# Altium schematic sheet PCB_Down.SchDoc
size A1
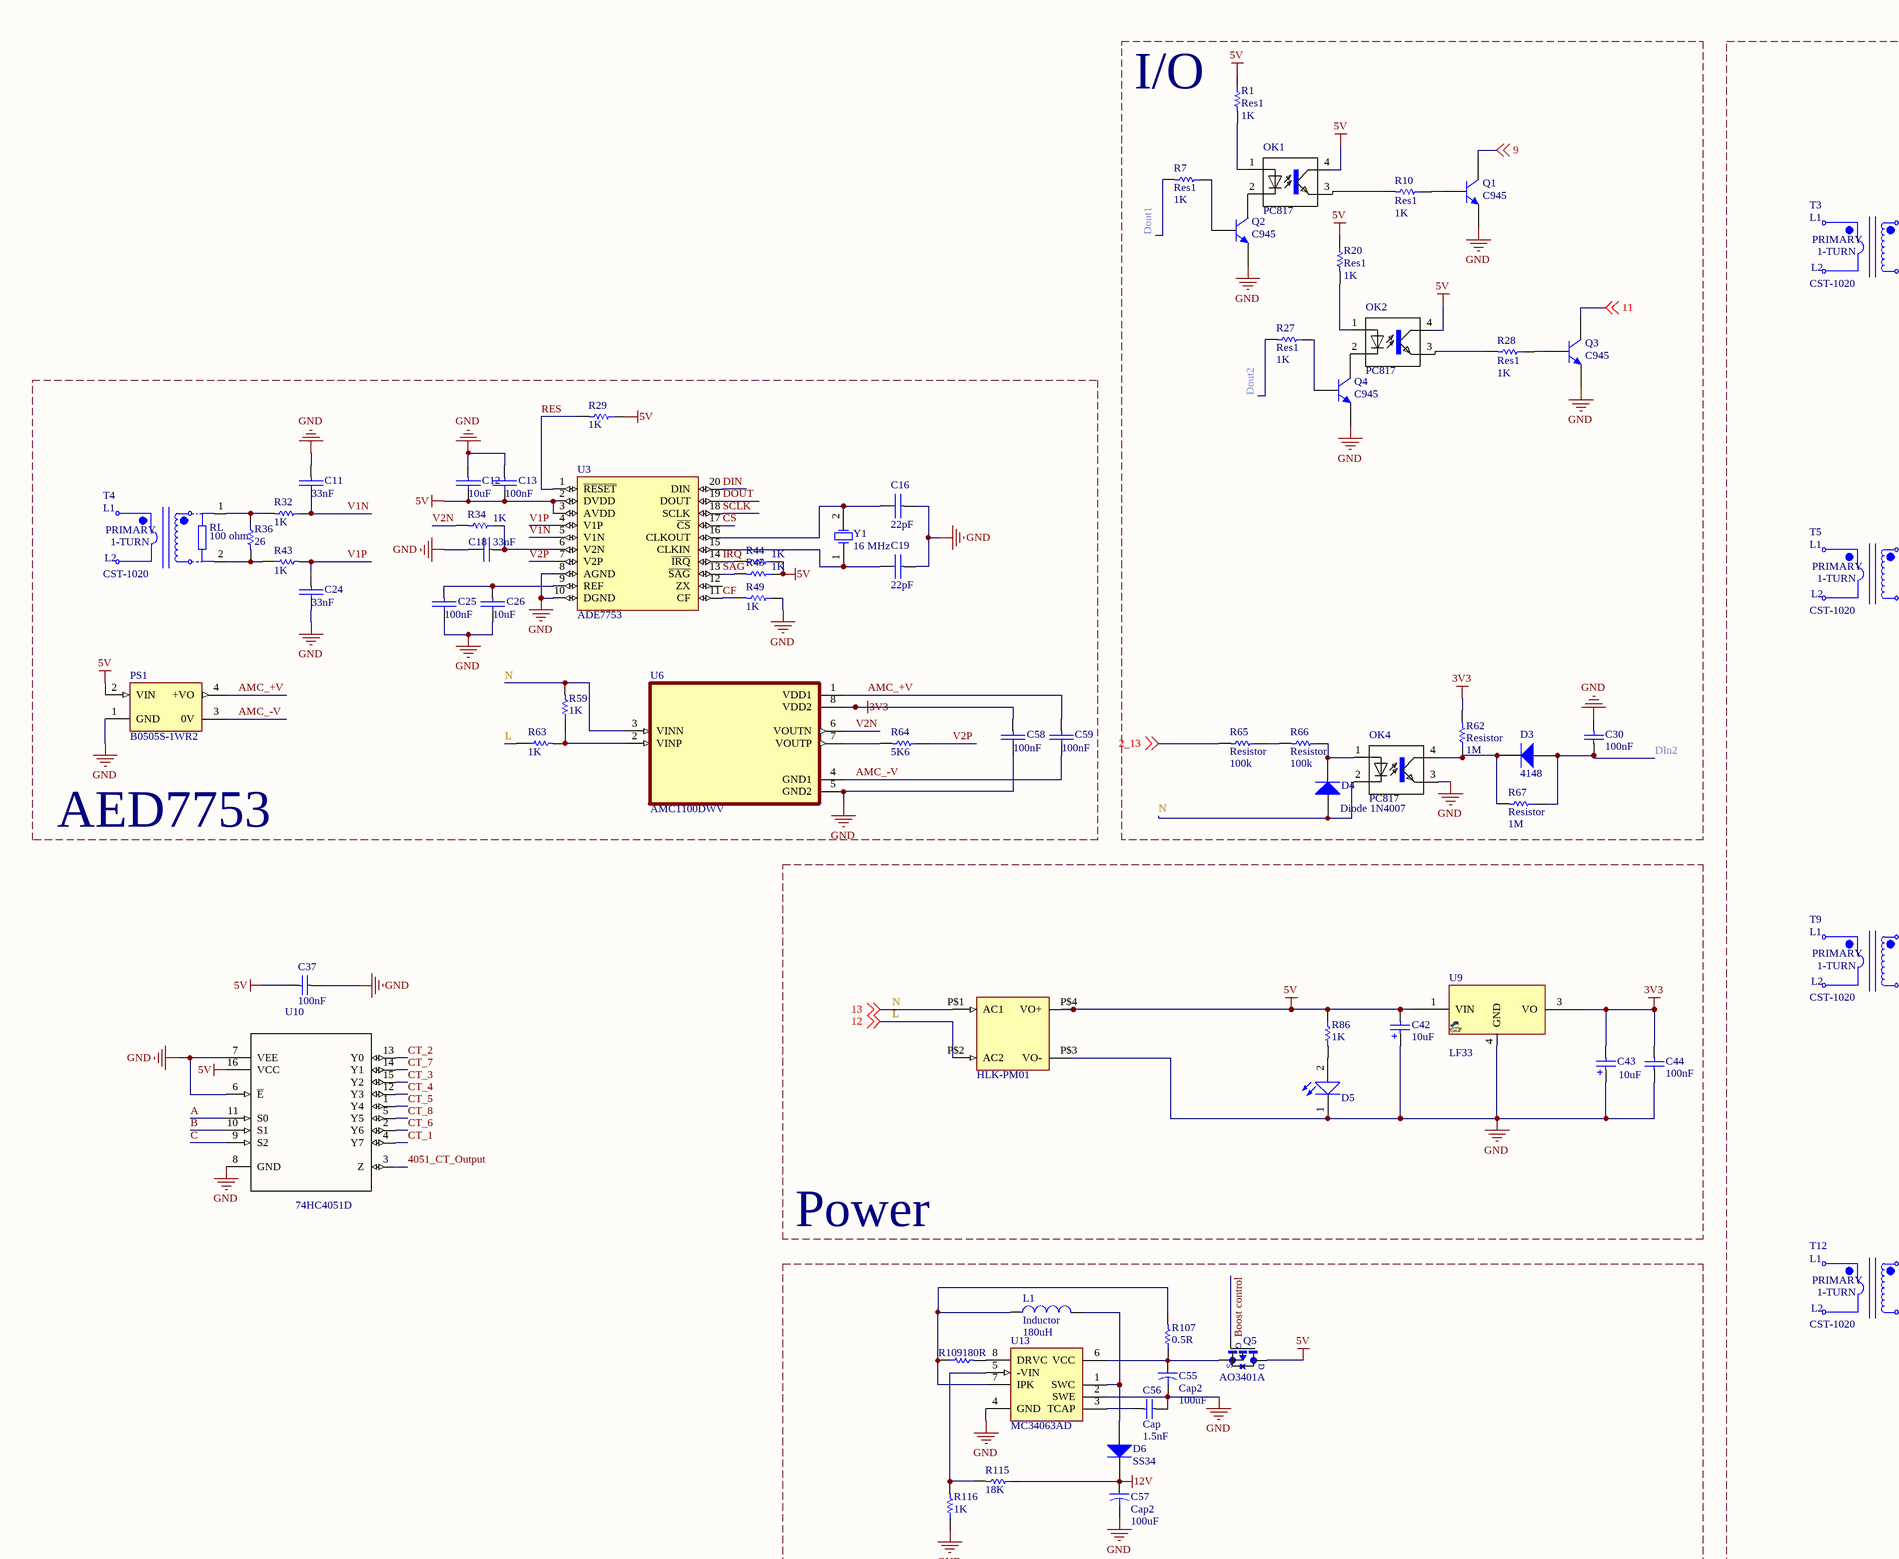
[diagram p0: PCB_Down.SchDoc, top left]
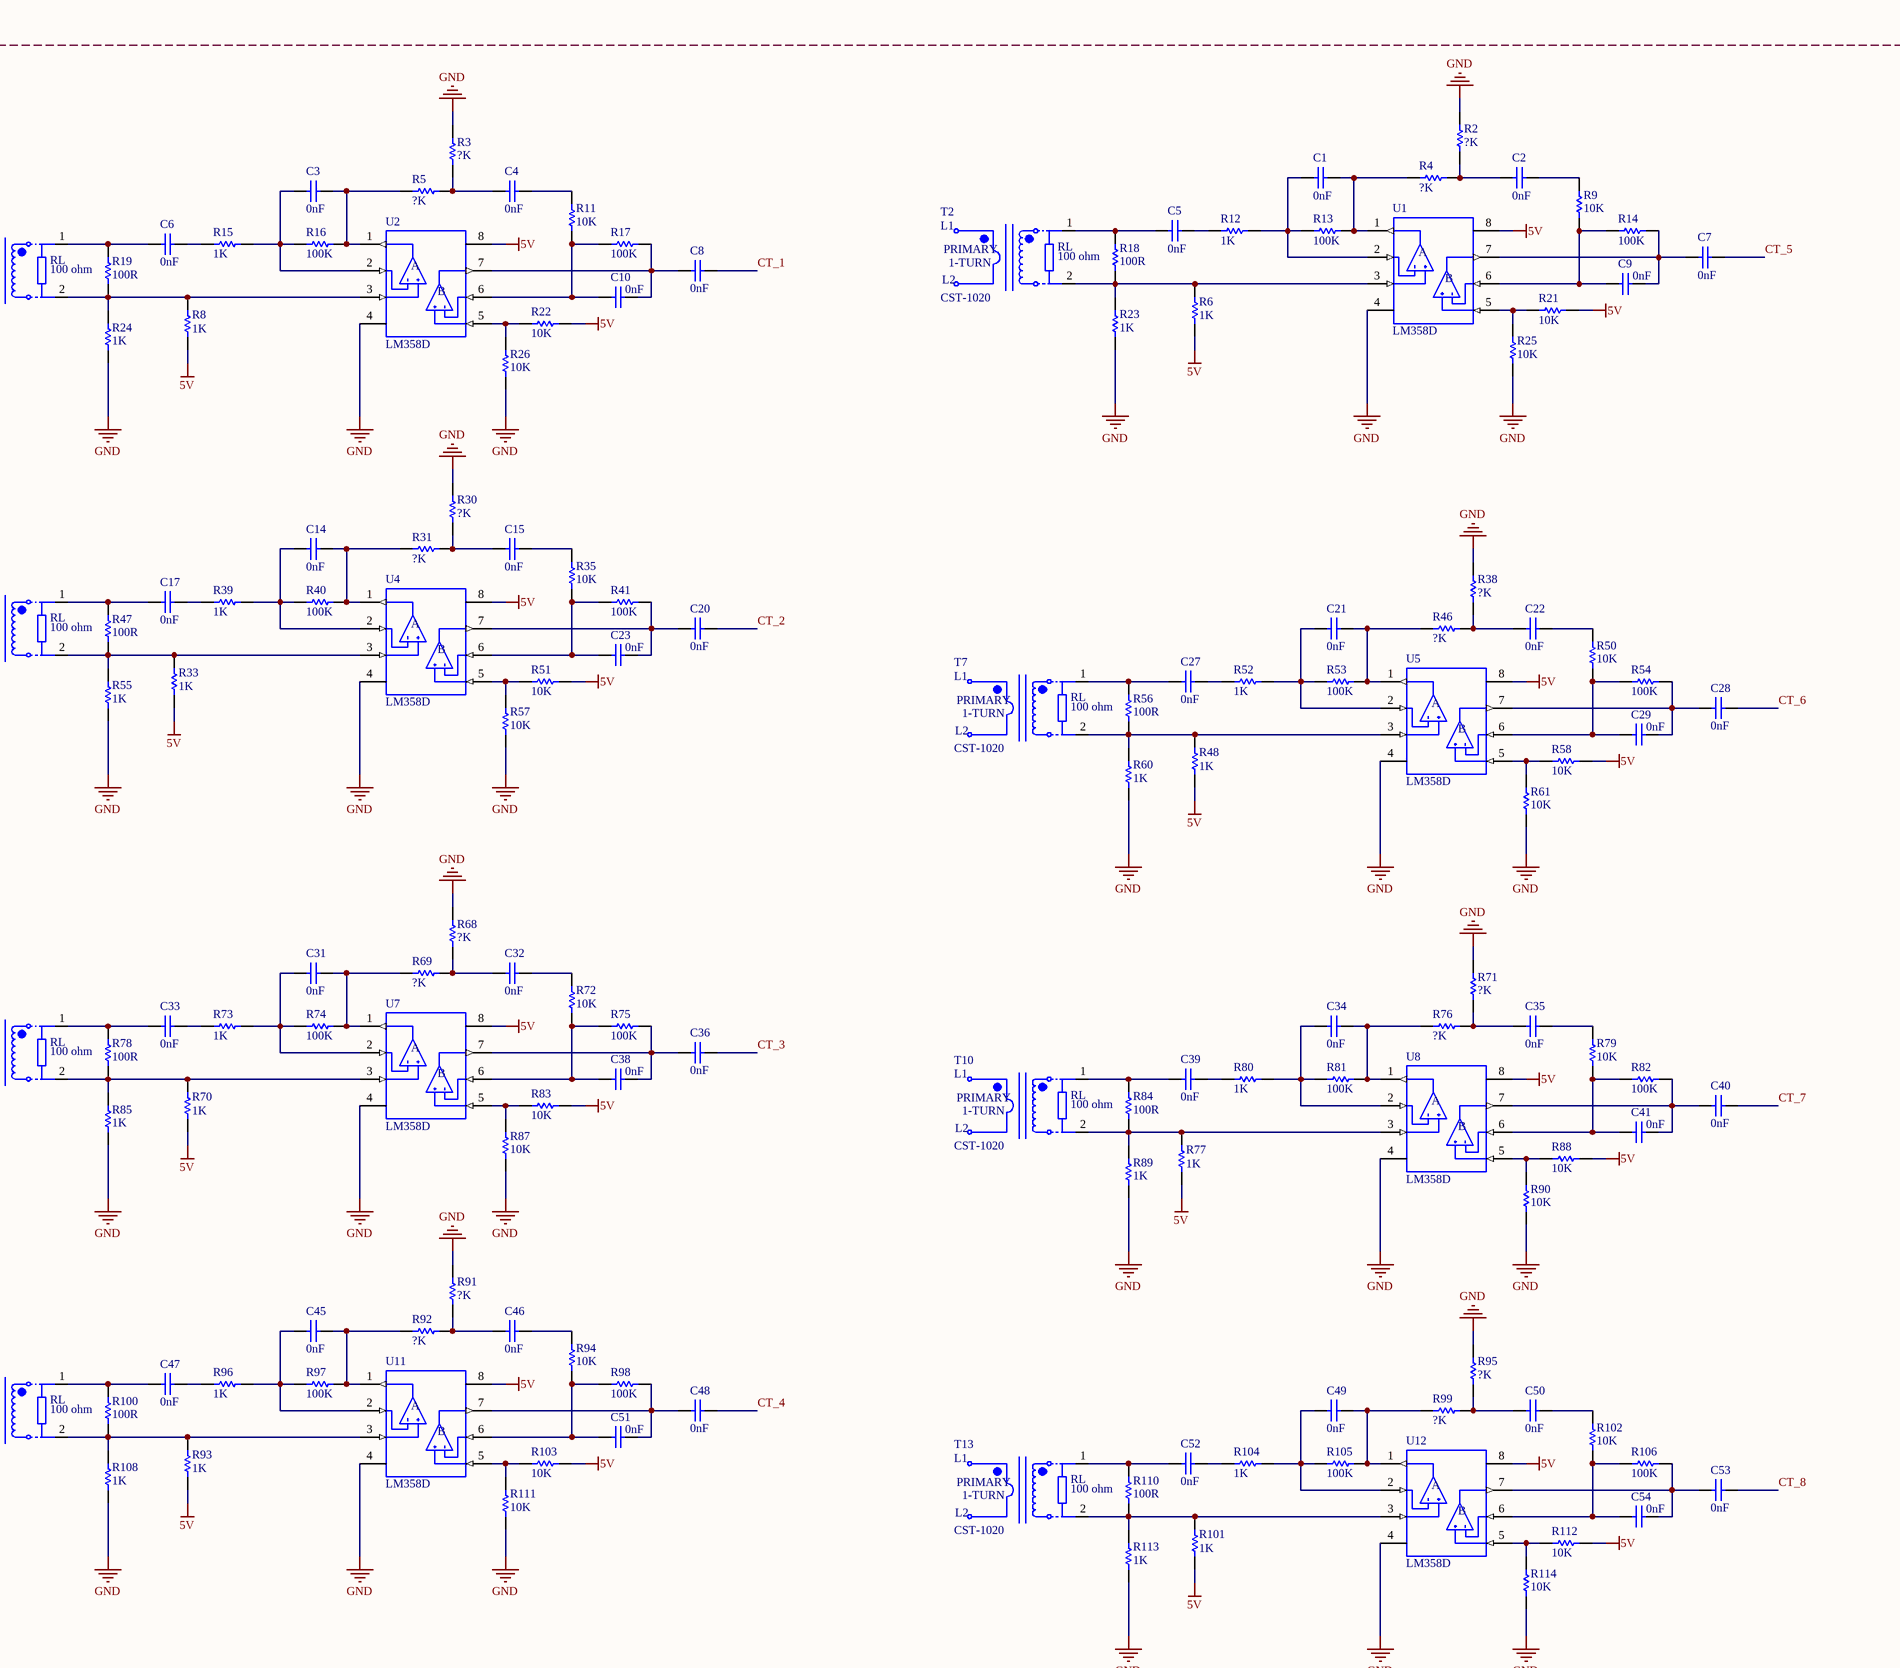
[diagram p1: PCB_Down.SchDoc, top right]
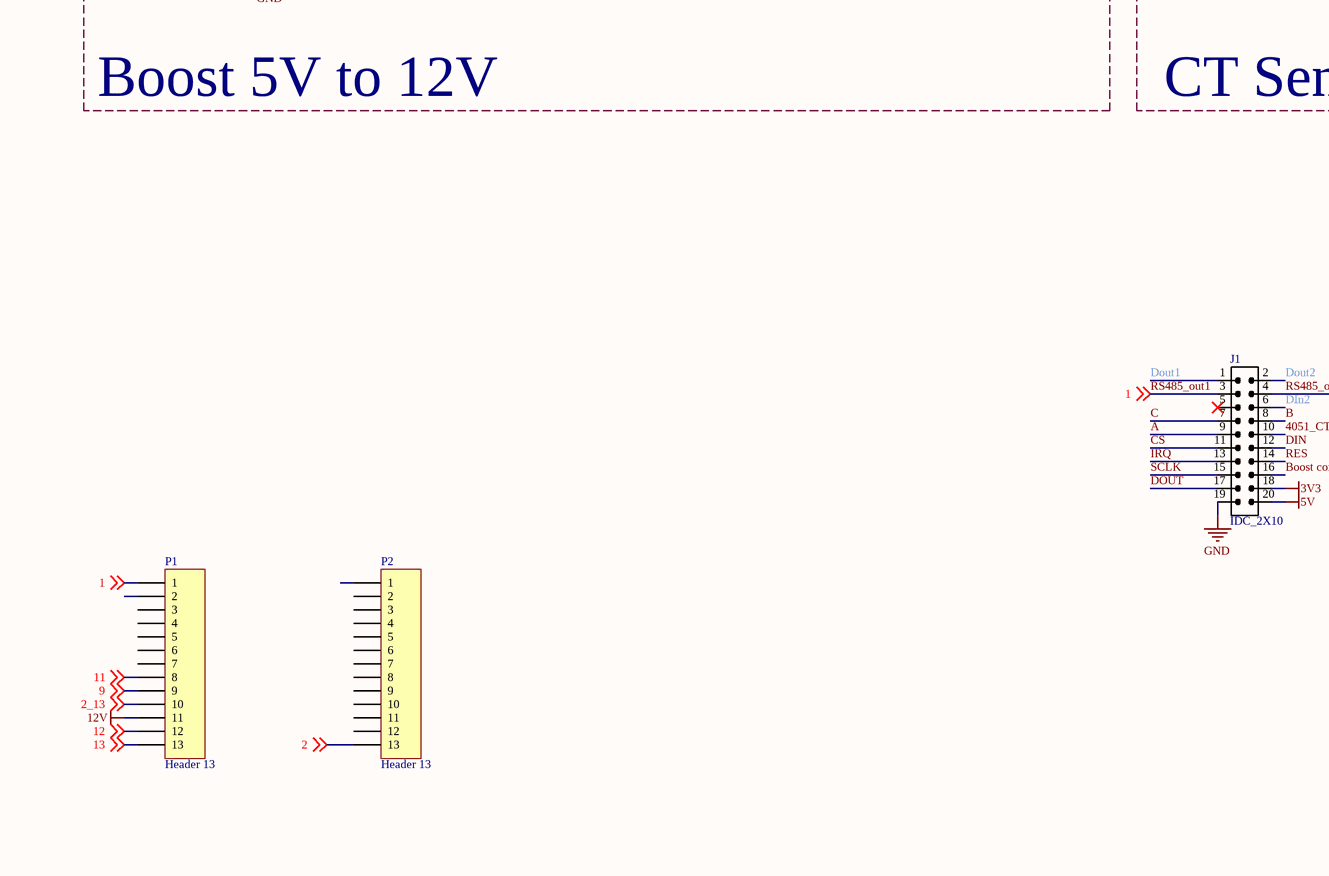
[diagram p2: PCB_Down.SchDoc, bottom left]
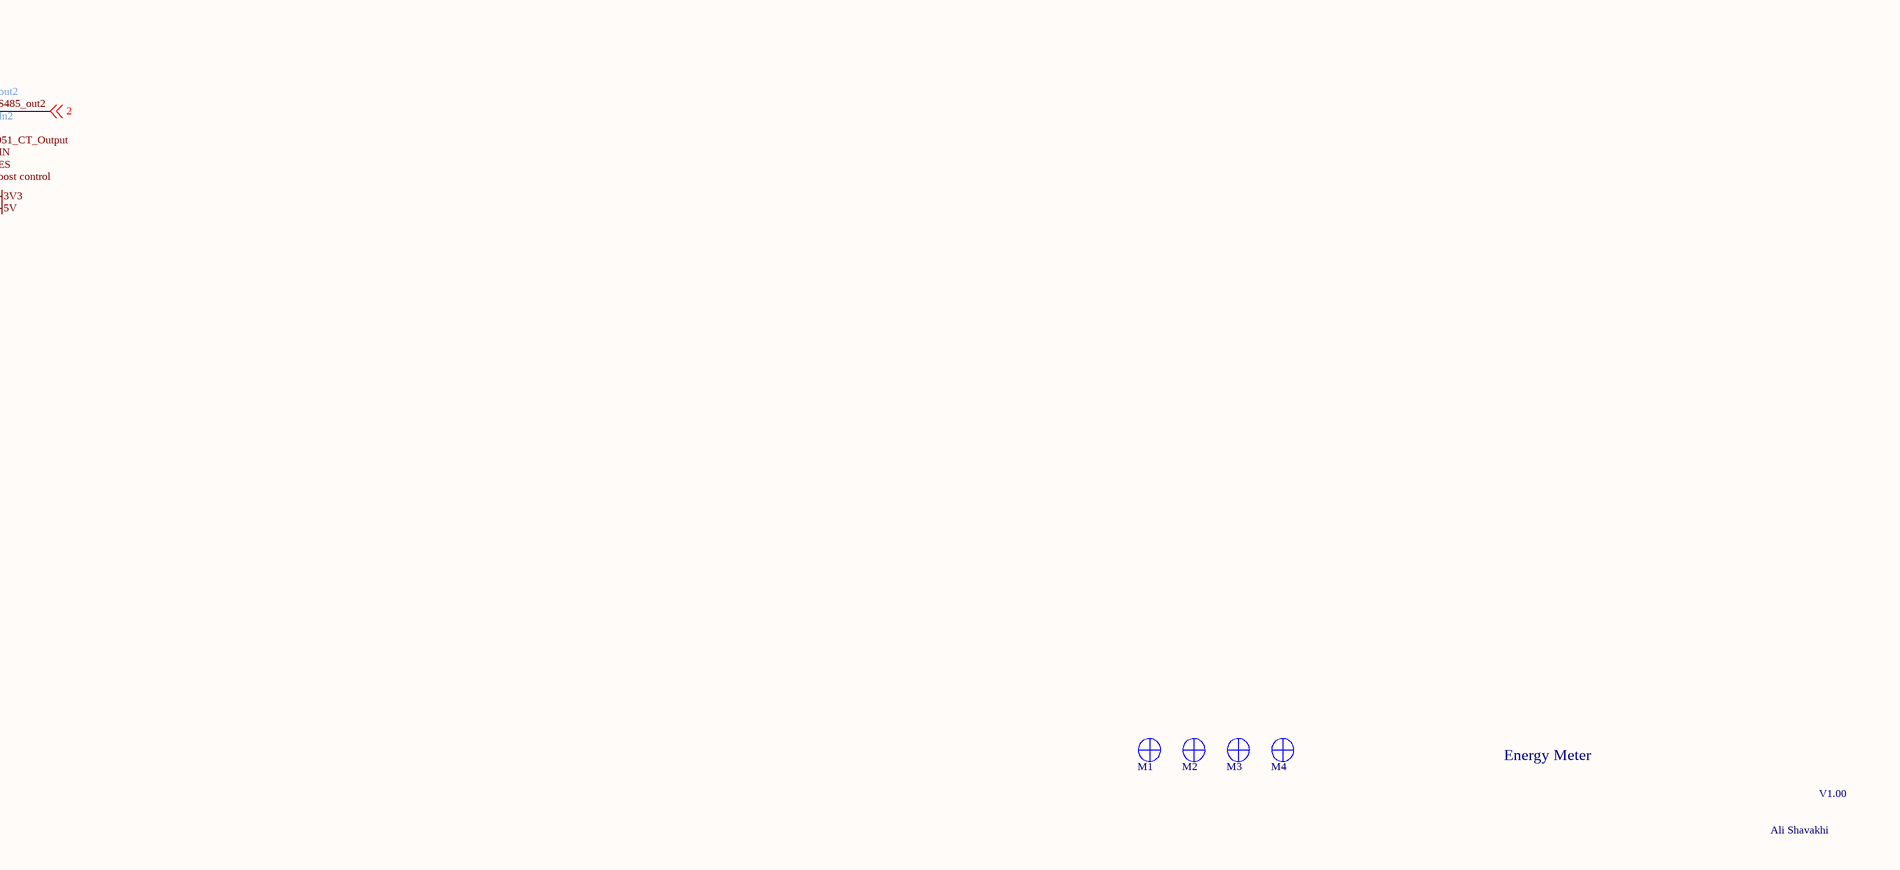
[diagram p3: PCB_Down.SchDoc, bottom right]

## Parts
?  HLK-PM01  [HLK-PM01]
C1  0nF  [0805]
C2  0nF  [0805]
C3  0nF  [0805]
C4  0nF  [0805]
C5  0nF  [0805]
C6  0nF  [0805]
C7  0nF  [0805]
C8  0nF  [0805]
C9  0nF  [0805]
C10  0nF  [0805]
C11  33nF  [0805]
C12  10uF  [0805]
C13  100nF  [0805]
C14  0nF  [0805]
C15  0nF  [0805]
C16  22pF  [0805]
C17  0nF  [0805]
C18  33nF  [0805]
C19  22pF  [0805]
C20  0nF  [0805]
C21  0nF  [0805]
C22  0nF  [0805]
C23  0nF  [0805]
C24  33nF  [0805]
C25  100nF  [0805]
C26  10uF  [0805]
C27  0nF  [0805]
C28  0nF  [0805]
C29  0nF  [0805]
C30  100nF  [0805]
C31  0nF  [0805]
C32  0nF  [0805]
C33  0nF  [0805]
C34  0nF  [0805]
C35  0nF  [0805]
C36  0nF  [0805]
C37  100nF  [0805]
C38  0nF  [0805]
C39  0nF  [0805]
C40  0nF  [0805]
C41  0nF  [0805]
C42  10uF  [Cap1206_(3216X18L)Size A]
C43  10uF  [Cap1206_(3216X18L)Size A]
C44  100nF  [0805]
C45  0nF  [0805]
C46  0nF  [0805]
C47  0nF  [0805]
C48  0nF  [0805]
C49  0nF  [0805]
C50  0nF  [0805]
C51  0nF  [0805]
C52  0nF  [0805]
C53  0nF  [0805]
C54  0nF  [0805]
C55  Cap2  value 100uF  [cap 100uF]
C56  Cap  value 1.5nF  [CAP805]
C57  Cap2  value 100uF  [cap 100uF]
C58  100nF  [0805]
C59  100nF  [0805]
D3  4148  [Diode 1n4148 SMD]
D4  Diode 1N4007  [Diode 1N4007 SMD]
D5  LED SMD PACKAGE  [LED_SMD_0805]  (value not drawn)
D6  SS34  [Diode 1N4007 SMD]
J1  IDC_2X10  [IDC_2X10]
L1  Inductor  value 180uH  [AXIAL-0.4]
M1  Screw  [Board Screw]  (value not drawn)
M2  Screw  [Board Screw]  (value not drawn)
M3  Screw  [Board Screw]  (value not drawn)
M4  Screw  [Board Screw]  (value not drawn)
OK1  PC817  [SMT Gullwing Lead-Form]
OK2  PC817  [SMT Gullwing Lead-Form]
OK4  PC817  [SMT Gullwing Lead-Form]
P1  Header 13  [terminal 13p]
P2  Header 13  [terminal 13p]
PS1  B0505S-1WR2  [CONV_B0505S-1WR2]
Q1  C945  [SOT23_BEC_M]
Q2  C945  [SOT23_BEC_M]
Q3  C945  [SOT23_BEC_M]
Q4  C945  [SOT23_BEC_M]
Q5  AO3401A  [AO3401A]
R1  Res1  value 1K  [0805]
R2  ?K  [0805]
R3  ?K  [0805]
R4  ?K  [0805]
R5  ?K  [0805]
R6  1K  [0805]
R7  Res1  value 1K  [0805]
R8  1K  [0805]
R9  10K  [0805]
R10  Res1  value 1K  [0805]
R11  10K  [0805]
R12  1K  [0805]
R13  100K  [0805]
R14  100K  [0805]
R15  1K  [0805]
R16  100K  [0805]
R17  100K  [0805]
R18  100R  [0805]
R19  100R  [0805]
R20  Res1  value 1K  [0805]
R21  10K  [0805]
R22  10K  [0805]
R23  1K  [0805]
R24  1K  [0805]
R25  10K  [0805]
R26  10K  [0805]
R27  Res1  value 1K  [0805]
R28  Res1  value 1K  [0805]
R29  1K  [0805]
R30  ?K  [0805]
R31  ?K  [0805]
R32  1K  [0805]
R33  1K  [0805]
R34  1K  [0805]
R35  10K  [0805]
R36  26  [0805]
R38  ?K  [0805]
R39  1K  [0805]
R40  100K  [0805]
R41  100K  [0805]
R43  1K  [0805]
R44  1K  [0805]
R45  1K  [0805]
R46  ?K  [0805]
R47  100R  [0805]
R48  1K  [0805]
R49  1K  [0805]
R50  10K  [0805]
R51  10K  [0805]
R52  1K  [0805]
R53  100K  [0805]
R54  100K  [0805]
R55  1K  [0805]
R56  100R  [0805]
R57  10K  [0805]
R58  10K  [0805]
R59  1K  [0805]
R60  1K  [0805]
R61  10K  [0805]
R62  Resistor  value 1M  [0805]
R63  1K  [0805]
R64  5K6  [0805]
R65  Resistor  value 100k  [0805]
R66  Resistor  value 100k  [0805]
R67  Resistor  value 1M  [0805]
R68  ?K  [0805]
R69  ?K  [0805]
R70  1K  [0805]
R71  ?K  [0805]
R72  10K  [0805]
R73  1K  [0805]
R74  100K  [0805]
R75  100K  [0805]
R76  ?K  [0805]
R77  1K  [0805]
R78  100R  [0805]
R79  10K  [0805]
R80  1K  [0805]
R81  100K  [0805]
R82  100K  [0805]
R83  10K  [0805]
R84  100R  [0805]
R85  1K  [0805]
R86  1K  [0805]
R87  10K  [0805]
R88  10K  [0805]
R89  1K  [0805]
R90  10K  [0805]
R91  ?K  [0805]
R92  ?K  [0805]
R93  1K  [0805]
R94  10K  [0805]
R95  ?K  [0805]
R96  1K  [0805]
R97  100K  [0805]
R98  100K  [0805]
R99  ?K  [0805]
R100  100R  [0805]
R101  1K  [0805]
R102  10K  [0805]
R103  10K  [0805]
R104  1K  [0805]
R105  100K  [0805]
R106  100K  [0805]
R107  value 0.5R  [0805]  (hidden comment: Res1)
R108  1K  [0805]
R109  value 180R  [0805]  (hidden comment: Res1)
R110  100R  [0805]
R111  10K  [0805]
R112  10K  [0805]
R113  1K  [0805]
R114  10K  [0805]
R115  value 18K  [0805]  (hidden comment: Res1)
R116  value 1K  [0805]  (hidden comment: Res1)
T2  CST-1020  [zmct103c]
T3  CST-1020  [zmct103c]
T4  CST-1020  [CT1005A]
T5  CST-1020  [zmct103c]
T7  CST-1020  [zmct103c]
T9  CST-1020  [zmct103c]
T10  CST-1020  [zmct103c]
T12  CST-1020  [zmct103c]
T13  CST-1020  [zmct103c]
U1  LM358D  [SOIC127P599X175-8N]
U2  LM358D  [SOIC127P599X175-8N]
U3  ADE7753  [SSOP-20]
U4  LM358D  [SOIC127P599X175-8N]
U5  LM358D  [SOIC127P599X175-8N]
U6  AMC1100DWV  [SOIC 8 - THPAD]
U7  LM358D  [SOIC127P599X175-8N]
U8  LM358D  [SOIC127P599X175-8N]
U9  LF33  [DPAK_3]
U10  74HC4051D  [SOIC127P600X175-16N]
U11  LM358D  [SOIC127P599X175-8N]
U12  LM358D  [SOIC127P599X175-8N]
U13  MC34063AD  [SOIC127P599X175-8N]
Y1  16 MHz  [Crystal SMD]

## Nets
3V3: C43.2 C44.1 C58.2(-) J1.18 R62.2 U6.8(VDD2) U9.3(VO)
5V: ?.P$4(VO+) C12.1(+) C13.1(+) C37.1 C42.2 J1.20 OK1.4(COL) OK2.4(COL) PS1.2(VIN) Q5.3(D) R1.1 R6.2 R8.2 R20.1 R21.2 R22.2 R29.1 R33.2 R44.1 R45.1 R48.2 R51.2 R58.2 R70.2 R77.2 R83.2 R86.1 R88.2 R93.2 R101.2 R103.2 R112.2 U1.8(V+) U2.8(V+) U3.2(DVDD) U3.3(AVDD) U4.8(V+) U5.8(V+) U7.8(V+) U8.8(V+) U9.1(VIN) U10.16(VCC) U11.8(V+) U12.8(V+)
12V: C57.1 D6.2(K) P1.11 R115.1
GND: ?.P$3(VO-) C11.2(-) C12.2(-) C13.2(-) C16.2(-) C18.1(+) C19.2(-) C24.1(+) C25.1(+) C26.1(+) C30.1 C37.2 C42.1 C43.1 C44.2 C55.2 C56.1 C57.2 C58.1(+) D5.1(K) J1.19 OK4.3(EMIT) PS1.1(GND) Q1.2(E) Q2.2(E) Q3.2(E) Q4.2(E) R2.1 R3.1 R23.1 R24.1 R25.1 R26.1 R30.1 R38.1 R49.1 R55.1 R57.1 R60.1 R61.1 R68.1 R71.1 R85.1 R87.1 R89.1 R90.1 R91.1 R95.1 R108.1 R111.1 R113.1 R114.1 R116.1 U1.4(V-) U2.4(V-) U3.8(AGND) U3.10(DGND) U4.4(V-) U5.4(V-) U6.5(GND2) U7.4(V-) U8.4(V-) U9.4(GND) U10.6(~{E}) U10.7(VEE) U10.8(GND) U11.4(V-) U12.4(V-) U13.2(SWE) U13.4(GND)
2_13: P1.10 R65.2 ; off-sheet 2_13
9: P1.9 Q1.3(C) ; off-sheet 9
11: P1.8 Q3.3(C) ; off-sheet 11
4051_CT_Output: J1.10 U10.3(Z)
A: J1.9 U10.11(S0)
AMC_+V: C59.2(-) PS1.4(+VO) U6.1(VDD1)
AMC_-V: C59.1(+) PS1.3(0V) U6.4(GND1)
B: J1.8 U10.10(S1)
Boost control: J1.16 Q5.1(G)
C: J1.7 U10.9(S2)
CF: R49.2 U3.11(CF)
CS: J1.11 U3.17(~{CS})
CT_1: C8.1 U10.4(Y7)
CT_2: C20.1 U10.13(Y0)
CT_3: C36.1 U10.15(Y2)
CT_4: C48.1 U10.12(Y3)
CT_5: C7.1 U10.1(Y4)
CT_6: C28.1 U10.2(Y6)
CT_7: C40.1 U10.14(Y1)
CT_8: C53.1 U10.5(Y5)
DIN: J1.12 U3.20(DIN)
DIn2: C30.2 D3.1(A) J1.6 R67.1
DOUT: J1.17 U3.19(DOUT)
Dout1: J1.1 R7.2
Dout2: J1.2 R27.2
IRQ: J1.13 R44.2 U3.14(~{IRQ})
L: ?.P$2(AC2) P1.12 R63.1 ; off-sheet 12  [also labelled 12]
N: ?.P$1(AC1) D4.1(A) OK4.2(C) P1.13 R59.2 U6.3(VINN) ; off-sheet 13  [also labelled 13]
RES: J1.14 R29.2 U3.1(~{RESET})
RS485_out1: J1.3 P1.1 ; off-sheet 1  [also labelled 1]
RS485_out2: J1.4 P2.13 ; off-sheet 2  [also labelled 2]
SAG: R45.2 U3.13(~{SAG})
SCLK: J1.15 U3.18(SCLK)
V1N: C11.1(+) R32.1 U3.5(V1N)
V1P: C24.2(-) R43.2 U3.4(V1P)
V2N: R34.2 U6.6(VOUTN)
V2P: R64.1 U3.7(V2P)
NetC1_1: C1.1 R4.2 R13.1 U1.1(OUT1)
NetC1_2: C1.2 R12.1 R13.2 U1.2(IN1-)
NetC2_1: C2.1 R9.2
NetC2_2: C2.2 R2.2 R4.1
NetC3_1: C3.1 R5.2 R16.1 U2.1(OUT1)
NetC3_2: C3.2 R15.1 R16.2 U2.2(IN1-)
NetC4_1: C4.1 R11.2
NetC4_2: C4.2 R3.2 R5.1
NetC5_1: C5.1 R12.2
NetC5_2: C5.2 R18.2 T2.1
NetC6_1: C6.1 R15.2
NetC6_2: C6.2 R19.2 T3.1
NetC7_2: C7.2 C9.1 R14.1 U1.7(OUT2)
NetC8_2: C8.2 C10.1 R17.1 U2.7(OUT2)
NetC9_2: C9.2 R9.1 R14.2 U1.6(IN2-)
NetC10_2: C10.2 R11.1 R17.2 U2.6(IN2-)
NetC14_1: C14.1 R31.2 R40.1 U4.1(OUT1)
NetC14_2: C14.2 R39.1 R40.2 U4.2(IN1-)
NetC15_1: C15.1 R35.2
NetC15_2: C15.2 R30.2 R31.1
NetC16_1: C16.1(+) U3.16(CLKOUT) Y1.2(OSC2)
NetC17_1: C17.1 R39.2
NetC17_2: C17.2 R47.2 T5.1
NetC18_2: C18.2(-) R34.1 U3.6(V2N)
NetC19_1: C19.1(+) U3.15(CLKIN) Y1.1(OSC1)
NetC20_2: C20.2 C23.1 R41.1 U4.7(OUT2)
NetC21_1: C21.1 R46.2 R53.1 U5.1(OUT1)
NetC21_2: C21.2 R52.1 R53.2 U5.2(IN1-)
NetC22_1: C22.1 R50.2
NetC22_2: C22.2 R38.2 R46.1
NetC23_2: C23.2 R35.1 R41.2 U4.6(IN2-)
NetC25_2: C25.2(-) C26.2(-) U3.9(REF)
NetC27_1: C27.1 R52.2
NetC27_2: C27.2 R56.2 T7.1
NetC28_2: C28.2 C29.1 R54.1 U5.7(OUT2)
NetC29_2: C29.2 R50.1 R54.2 U5.6(IN2-)
NetC31_1: C31.1 R69.2 R74.1 U7.1(OUT1)
NetC31_2: C31.2 R73.1 R74.2 U7.2(IN1-)
NetC32_1: C32.1 R72.2
NetC32_2: C32.2 R68.2 R69.1
NetC33_1: C33.1 R73.2
NetC33_2: C33.2 R78.2 T9.1
NetC34_1: C34.1 R76.2 R81.1 U8.1(OUT1)
NetC34_2: C34.2 R80.1 R81.2 U8.2(IN1-)
NetC35_1: C35.1 R79.2
NetC35_2: C35.2 R71.2 R76.1
NetC36_2: C36.2 C38.1 R75.1 U7.7(OUT2)
NetC38_2: C38.2 R72.1 R75.2 U7.6(IN2-)
NetC39_1: C39.1 R80.2
NetC39_2: C39.2 R84.2 T10.1
NetC40_2: C40.2 C41.1 R82.1 U8.7(OUT2)
NetC41_2: C41.2 R79.1 R82.2 U8.6(IN2-)
NetC45_1: C45.1 R92.2 R97.1 U11.1(OUT1)
NetC45_2: C45.2 R96.1 R97.2 U11.2(IN1-)
NetC46_1: C46.1 R94.2
NetC46_2: C46.2 R91.2 R92.1
NetC47_1: C47.1 R96.2
NetC47_2: C47.2 R100.2 T12.1
NetC48_2: C48.2 C51.1 R98.1 U11.7(OUT2)
NetC49_1: C49.1 R99.2 R105.1 U12.1(OUT1)
NetC49_2: C49.2 R104.1 R105.2 U12.2(IN1-)
NetC50_1: C50.1 R102.2
NetC50_2: C50.2 R95.2 R99.1
NetC51_2: C51.2 R94.1 R98.2 U11.6(IN2-)
NetC52_1: C52.1 R104.2
NetC52_2: C52.2 R110.2 T13.1
NetC53_2: C53.2 C54.1 R106.1 U12.7(OUT2)
NetC54_2: C54.2 R102.1 R106.2 U12.6(IN2-)
NetC55_1: C55.1 Q5.2(S) R107.1 U13.6(VCC)
NetC56_2: C56.2 U13.3(TCAP)
NetD3_2: D3.2(K) OK4.4(COL) R62.1 R67.2
NetD4_2: D4.2(K) OK4.1(A) R66.1
NetD5_2: D5.2(A) R86.2
NetD6_1: D6.1(A) L1.2 U13.1(SWC)
NetL1_1: L1.1 R107.2 R109.1 U13.7(IPK)
NetOK1_1: OK1.1(A) R1.2
NetOK1_2: OK1.2(C) Q2.3(C)
NetOK1_3: OK1.3(EMIT) R10.2
NetOK2_1: OK2.1(A) R20.2
NetOK2_2: OK2.2(C) Q4.3(C)
NetOK2_3: OK2.3(EMIT) R28.2
NetQ1_1: Q1.1(B) R10.1
NetQ2_1: Q2.1(B) R7.1
NetQ3_1: Q3.1(B) R28.1
NetQ4_1: Q4.1(B) R27.1
NetR6_1: R6.1 R18.1 R23.2 T2.2 U1.3(IN1+)
NetR8_1: R8.1 R19.1 R24.2 T3.2 U2.3(IN1+)
NetR21_1: R21.1 R25.2 U1.5(IN2+)
NetR22_1: R22.1 R26.2 U2.5(IN2+)
NetR32_2: R32.2 R36.1 T4.1
NetR33_1: R33.1 R47.1 R55.2 T5.2 U4.3(IN1+)
NetR36_2: R36.2 R43.1 T4.2
NetR48_1: R48.1 R56.1 R60.2 T7.2 U5.3(IN1+)
NetR51_1: R51.1 R57.2 U4.5(IN2+)
NetR58_1: R58.1 R61.2 U5.5(IN2+)
NetR59_1: R59.1 R63.2 U6.2(VINP)
NetR64_2: R64.2 U6.7(VOUTP)
NetR65_1: R65.1 R66.2
NetR70_1: R70.1 R78.1 R85.2 T9.2 U7.3(IN1+)
NetR77_1: R77.1 R84.1 R89.2 T10.2 U8.3(IN1+)
NetR83_1: R83.1 R87.2 U7.5(IN2+)
NetR88_1: R88.1 R90.2 U8.5(IN2+)
NetR93_1: R93.1 R100.1 R108.2 T12.2 U11.3(IN1+)
NetR101_1: R101.1 R110.1 R113.2 T13.2 U12.3(IN1+)
NetR103_1: R103.1 R111.2 U11.5(IN2+)
NetR109_2: R109.2 U13.8(DRVC)
NetR112_1: R112.1 R114.2 U12.5(IN2+)
NetR115_2: R115.2 R116.2 U13.5(-VIN)

Not connected (* = marked no-connect by the designer): J1 5*; P1 2 3 4 5 6 7; P2 1 2 3 4 5 6 7 8 9 10 11 12; U3 12(ZX)

## Notes on the sheet
- (near R1) I/O
- AED7753
- Power
- Boost 5V to 12V
- CT Sensor
- Energy Meter
- Ali Shavakhi
- V1.00
- (in symbol CST-1020) L1; PRIMARY; RL; 100 ohm; 1-TURN; L2
- (in symbol LM358D) A; B

## Library data of the parts
? = HLK-PM01: HI-LINK Ultra-compact power module HLK-PM01<p> <ul> <li>Meet UL, CE requirements</li> <li>Ultra-thin, ultra-small</li> <li>All voltage input (AC: 90 ~ 264V)</li> <li>Low ripple and low noise</li> <li>Output overload and short circuit protection</li> <li>High efficiency, high power density</li> <li>The product is designed to meet the requirements of EMC and Safety Test</li> <li>Low power consumption, environmental protection, no-load loss <0.1W</li> <li>100% load aging and testing</li>; Availability: Unavailable; Price: None; SnapEDA_Link: https://www.snapeda.com/parts/hlk-pm01/Hi-link/view-part/2875605/?ref=snap; Value: *; Package: Package Analog Devices; MF: Hi-link; MP: hlk-pm01
C1-C10 C14 C15 C17 C20-C23 C27-C29 C31-C36 C38-C41 C45-C54 = CAP SMD PACKAGE: TOTAL CAPACITOR SMD PACK; Designer: Abbas Basereh; Desc.: CAP SMD TOTAL PACKAGES; VALUE: 100nF; Data: 2017-3-10
C11-C13 C16 C18 C19 C24-C26 C58 C59 = Cap-Bipolar: Bipolar Capacitor; Voltage: 100V; Designer: Saeid Jorablo; Organazation: ControTec; Adding Date: 1387/12/20
  C11 C18 C24: Value: 33nF
  C12 C26: Value: 10uF
  C13 C25 C58 C59: Value: 100nF
  C16 C19: Value: 22pF
C30 C37 C44 = CAP SMD PACKAGE: TOTAL CAPACITOR SMD PACK; Designer: Abbas Basereh; Desc.: CAP SMD TOTAL PACKAGES; Data: 2017-3-10; VALUE: 100nF
C42 C43 = Cap_10uF_POL_10%_TANA: Polarized Capacitor,10uF,10V,10%,typeA,VISHAY; Manuf_Part_1: 293D106X9010A2TE3; Revision: July-2002: Re-released for DXP Platform.; Value: 10uF; Manuf_1: VISHAY; Order: *; ECCN_US/EU: n/a
C55 C57 = Cap2: Capacitor; Published: 23-Sep-2002; PackageReference: CAPR5-4X5; Publisher: Altium Limited; PackageDescription: Capacitor; 2 Leads
C56 = Cap: Capacitor; Published: 8-Jun-2000; LatestRevisionDate: 17-Jul-2002; LatestRevisionNote: Re-released for DXP Platform.; PackageReference: RAD-0.3; Publisher: Altium Limited; PackageDescription: Radial Cap, Thru-Hole; 2 Leads; 0.3 in Pin Spacing
D3 = Diode: Default Diode; Published: 8-Jun-2000; LatestRevisionDate: 17-Jul-2002; LatestRevisionNote: Re-released for DXP Platform.; PackageVersion: Sep-1996; PackageReference: SMC; Publisher: Altium Limited; PackageDescription: DO-214-AB/SMC; 2 C-Bend Leads; Body 7.9 x 5.9 mm, inc. leads (LxW); Code_JEDEC: DO-214-AB
D4 D6 = Diode 1N4007: 1 Amp General Purpose Rectifier; Published: 8-Jun-2000; LatestRevisionDate: 17-Jul-2002; LatestRevisionNote: Re-released for DXP Platform.; DatasheetVersion: 1998; PackageVersion: Aug-1999; PackageReference: DO-41; Publisher: Altium Limited; Code_JEDEC: DO-204-AL; ComponentLink1Description: Manufacturer Link; ComponentLink1URL: http://www.fairchildsemi.com/; ComponentLink2Description: Datasheet; ComponentLink2URL: http://www.fairchildsemi.com/ds/1N%2F1N4001.pdf
D5 = LED SMD PACKAGE: SMD Mono-color Chip LED Waterclear; Part Number: 150080BS75000; Peak Wavelength: 465 nm; Forward Voltage: 3.2 V; Published Date: Jan 2017; Publisher: Ali Hafizi
J1 = IDC_2X10: CONN, IDC, Male, pitch: 2.54mm, 20POS; VALUE: IDC_2X10
L1 = Inductor: Code_IEC: 1005; Published: 8-Jun-2000; LatestRevisionDate: 29-May-2009; LatestRevisionNote: IPC-7351 Footprint Added.; PackageReference: 0402-A; Publisher: Altium Limited; PackageDescription: Chip Inductor; Code_JEITA: 0402
M1-M4 = Board Screw 3MM: Board Screw With Spacer
OK1 OK2 OK4 = PC817: Optoisolator 5kv Trans 4smd; MP: PC817XI; MF: Sharp Microelectronics; Availability: Unavailable; Package: SMD-4 Sharp Microelectronics; Price: None; Value: *
P1 P2 = Header 13: Header, 13-Pin; LatestRevisionDate: 17-Jul-2002; LatestRevisionNote: Re-released for DXP Platform.; Publisher: Altium Limited
PS1 = B0505S-1WR2: 1W isolated DC-DC with Fixed Input Voltage;unregulated Single Output; MF: MORNSUN; Package: None; Price: None; Value: *; MP: B0505S-1WR2; SnapEDA_Link: https://www.snapeda.com/parts/B0505S-1WR2/MORNSUN/view-part/586695/?ref=snap; Availability: Unavailable
Q1-Q4 = C945: NPN Silicon Epitaxial Planar Transistor; Published: 2017-2-8; LatestRevisionDate: 2017; LatestRevisionNote: IPC-7351 Footprint Added.; DatasheetVersion: 2017; PackageVersion: 2017-2-8; PackageReference: SOT23; Publisher: Abbas Basereh; PackageDescription: 3-Pin SOT-23 Package 0.95 mm Pitch, 2.3 mm Lead Span; ComponentLink1Description: Manufacturer Link; ComponentLink1URL: http://www.taitroncomponents.com/; ComponentLink2Description: Datasheet; ComponentLink2URL: http://www.taitroncomponents.com/
Q5 = AO3401A: Trans MOSFET P-CH 30V 4A 3-Pin SOT-23; MF: Alpha &; Digi-Key_Part_Number: 785-1001-1-ND; SnapEDA_Link: https://www.snapeda.com/parts/AO3401A/Alpha%20%26%20Omega%20Semiconductor%20Inc./view-part/227978/?ref=snap; Digi-Key_Purchase_URL: https://www.digikey.com/product-detail/en/alpha-omega-semiconductor-inc/AO3401A/785-1001-1-ND/1855943?utm_source=snapeda&utm_medium=aggregator&utm_campaign=symbol; MP: AO3401A; Package: SOT-23 Alpha &amp; Omega Semiconductor; Value: *
R1 R7 R10 R20 R27 R28 R107 R109 R115 R116 = Res1: Resistor; Published: 8-Jun-2000; LatestRevisionDate: 17-Jul-2002; LatestRevisionNote: Re-released for DXP Platform.; PackageReference: AXIAL-0.3; Publisher: Altium Limited
  R107 R109 R115 R116: PackageDescription: Axial Device, Thru-Hole; 2 Leads; 0.3 in Pin Spacing
R2-R6 R8 R9 R11-R19 R21-R26 R29-R36 R38-R41 R43-R61 R63 R64 R68-R106 R108 R110-R114 = RES SMD PACKAGE: TOTAL SMD RESISTOR PACK; Designer: Abbas Basereh; Desc.: RES SMD PAKAGES; Data: 2017-3-10
R62 R65-R67 = Res1: Published: 8-Jun-2000; LatestRevisionDate: 17-Jul-2002; LatestRevisionNote: Re-released for DXP Platform.; PackageReference: AXIAL-0.3; Publisher: Altium Limited
T2-T5 T7 T9 T10 T12 T13 = CST-1020: 20A Current Sense Transformer 50/60Hz 40Ohm Through Hole; NOTE_1: User to provide the resistor; NOTE_2: User to provide primary; MF: Triad Magnetics; Value: *; MP: CST-1020; SnapEDA_Link: https://www.snapeda.com/parts/CST-1020/Triad%20Magnetics/view-part/49859/?ref=snap; Availability: Unavailable; Price: None; Package: Triad Magnetics
U1 U2 U4 U5 U7 U8 U11 U12 = LM358D: Dual standard operational amplifier 8-SOIC 0 to 70; MF: Texas Instruments; Digi-Key_Part_Number: 296-1014-2-ND; Arrow_Electronics-Purchase-URL: https://snapeda.com/shop?store=Arrow+Electronics&id=4793021; MP: LM358D; Value: *; SnapEDA_Link: https://www.snapeda.com/parts/LM358D/Texas%20Instruments/view-part/4793021/?ref=snap; DigiKey-Purchase-URL: https://snapeda.com/shop?store=DigiKey&id=4793021; Package: SOIC-8 Texas Instruments; Texas_Instruments-Purchase-URL: https://snapeda.com/shop?store=Texas+Instruments&id=4793021; Mouser-Purchase-URL: https://snapeda.com/shop?store=Mouser&id=4793021; Arrow_Asia-Purchase-URL: https://snapeda.com/shop?store=Arrow+Asia&id=4793021
U3 = ADE7753: IC ENERGY METERING 1PHASE 20SSOP; MF: Analog Devices; Digi-Key_Part_Number: ADE7753ARSZRLCT-ND; SnapEDA_Link: https://www.snapeda.com/parts/ADE7753/Analog%20Devices%20Inc./view-part/3209960/?ref=snap; Package: SSOP-20 Analog Devices; Value: *; MP: ADE7753
U6 = AMC1100DWV: Fully-Differential Isolation Amplifier, Low-Side Operation 3.3 v, Input Bandwidth 60 Khz Min; Package: None; Price: None; Value: *; MP: AMC1100DWV; Availability: Unavailable
U9 = VREG_LFXX_TO252: REG, Linear, LDO0.45V, 0.5A, TO-252; MANF: ST; PARAM2: 1.5/1.8/2.5/3.3/5V; MANF_P#: LF33; PARAM: LDO0.45V, 0.5A; PRICE: 1500t; VALUE: LF33
U10 = 74HC4051D: Single 8-Channel Analog Multiplexer/Demultiplexer, VCC=2 to 6V, PD=500mW, tpd/tpz=15ns_typ._; MF: Toshiba Semiconductor; SnapEDA_Link: https://www.snapeda.com/parts/74HC4051D/Toshiba%20Semiconductor%20and%20Storage/view-part/?ref=snap; MP: 74HC4051D; Availability: Unavailable; Package: SOIC-16 Toshiba; Price: None; Value: *
U13 = MC34063AD: DC-to-DC Converter Control Circuit; Published: 17-Jul-2002; LatestRevisionDate: 13-Apr-2006; LatestRevisionNote: IPC-7351 Footprint Added.; DatasheetVersion: 1988; PackageReference: 751-02; Publisher: Altium Limited; PackageDescription: 8-Pin Small Outline Integrated Circuit 1.27 mm Pitch; Code_JEDEC: MS-012-AA; Code_IPC: SOIC127P600-8; ComponentLink1Description: Manufacturer Link; ComponentLink1URL: http://www.onsemi.com/site/products/taxonomy/0,4438,503,00.html; ComponentLink2Description: Datasheet; ComponentLink2URL: http://www.onsemi.com/pub/Collateral/MC34063A-D.PDF
Y1 = XTAL: XTAL Crystal; Company: E.P.I.L; Design Date: 11/04/2011; Value: 16 MHz